# Altium project DT10965_MOTOR_CONTROLLER(1).PrjPcb (part 4 of 5)

## Sheet Pressure_sensor_AFE.SchDoc: =DT_SCH_Title
size A4; Organization: Droid Technologies; DocumentNumber: DT10965; Revision: 1.0; SheetNumber: 12; SheetTotal: 16
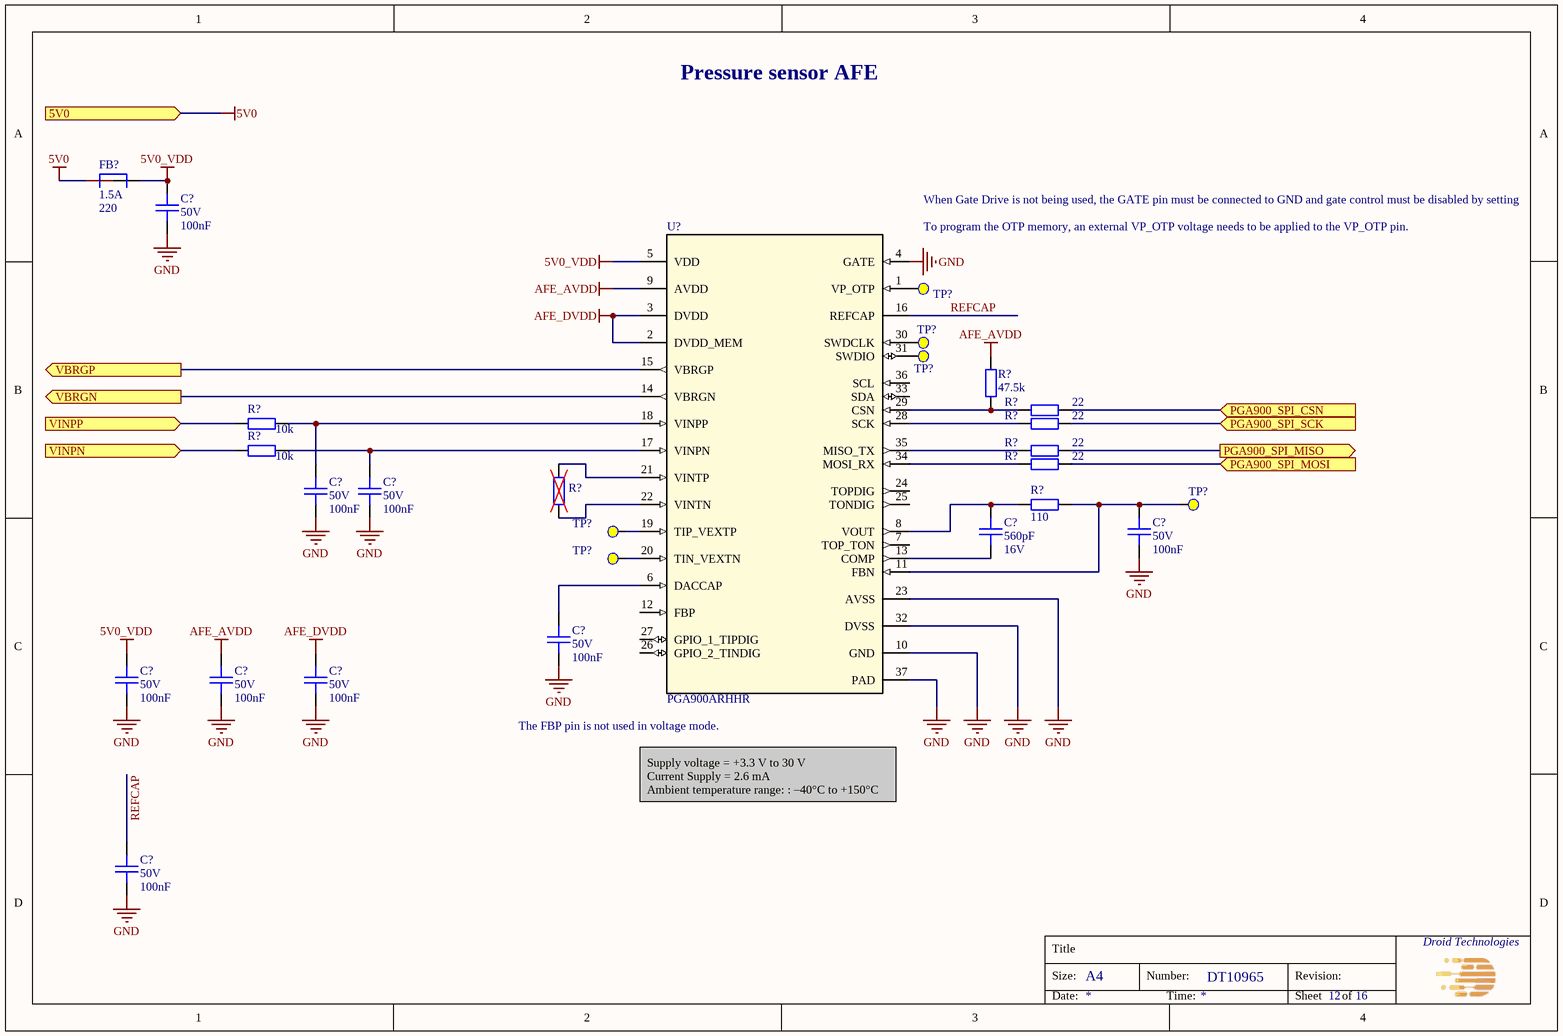
[diagram p11: Pressure_sensor_AFE.SchDoc]

### Parts
(Parts that share a designator on the sheet are numbered #1, #2 ... from top to bottom, then left to right.)
C?#24  Voltage Rating: 50V  Capacitance: 100nF  [CAPC100x50x50L25]  (hidden comment: GCM155L8EH104KE07D)
C?#25  Voltage Rating: 50V  Capacitance: 100nF  [CAPC100x50x50L25]  (hidden comment: GCM155L8EH104KE07D)
C?#26  Voltage Rating: 50V  Capacitance: 100nF  [CAPC100x50x50L25]  (hidden comment: GCM155L8EH104KE07D)
C?#27  Capacitance: 560pF  Voltage Rating: 16V  [CAPC100x50x50L25]  (hidden comment: C0402C561F4HACAUTO)
C?#28  Voltage Rating: 50V  Capacitance: 100nF  [CAPC100x50x50L25]  (hidden comment: GCM155L8EH104KE07D)
C?#29  Voltage Rating: 50V  Capacitance: 100nF  [CAPC100x50x50L25]  (hidden comment: GCM155L8EH104KE07D)
C?#30  Voltage Rating: 50V  Capacitance: 100nF  [CAPC100x50x50L25]  (hidden comment: GCM155L8EH104KE07D)
C?#31  Voltage Rating: 50V  Capacitance: 100nF  [CAPC100x50x50L25]  (hidden comment: GCM155L8EH104KE07D)
C?#32  Voltage Rating: 50V  Capacitance: 100nF  [CAPC100x50x50L25]  (hidden comment: GCM155L8EH104KE07D)
C?#33  Voltage Rating: 50V  Capacitance: 100nF  [CAPC100x50x50L25]  (hidden comment: GCM155L8EH104KE07D)
FB?#2  Imax: 1.5A  Impedance: 220  [BEADC160X80X95L40]  (hidden comment: BLM18KG221BH1D)
R?#32  Resistance: 47.5k  [RESC100X50X40L25]  (hidden comment: RC0402FR-0747K5L)
R?#33  Resistance: 22  [RESC100X50X40L25]  (hidden comment: RC0402FR-0722RL)
R?#34  Resistance: 10k  [RESC100X50X40L25]  (hidden comment: RC0402FR-0710KL)
R?#35  Resistance: 22  [RESC100X50X40L25]  (hidden comment: RC0402FR-0722RL)
R?#36  Resistance: 10k  [RESC100X50X40L25]  (hidden comment: RC0402FR-0710KL)
R?#37  Resistance: 22  [RESC100X50X40L25]  (hidden comment: RC0402FR-0722RL)
R?#38  Resistance: 22  [RESC100X50X40L25]  (hidden comment: RC0402FR-0722RL)
R?#39  Resistance: 110  [RESC100X50X40L25]  (hidden comment: RC0402FR-07110RL)
R?#40  DNP chip res 0603  [RESC160X80X55L30]  (value not drawn)
TP?#1  TPAD  [PAD_1.0R]  (value not drawn)  (no BOM)
TP?#2  TPAD  [PAD_1.0R]  (value not drawn)  (no BOM)
TP?#3  TPAD  [PAD_1.0R]  (value not drawn)  (no BOM)
TP?#4  TPAD  [PAD_1.0R]  (value not drawn)  (no BOM)
TP?#5  TPAD  [PAD_1.0R]  (value not drawn)  (no BOM)
TP?#6  TPAD  [PAD_1.0R]  (value not drawn)  (no BOM)
U?#9  PGA900ARHHR  [36VQFN]

### Ports
5V0 (in), PGA900_SPI_CSN (in), PGA900_SPI_MISO (out), PGA900_SPI_MOSI (in), PGA900_SPI_SCK (in), VBRGN (out), VBRGP (out), VINPN (in), VINPP (in)

### Nets
5V0: FB?#2.1 ; port 5V0
5V0_VDD: C?#24.2 C?#30.2 FB?#2.2 U?#9.5(VDD)
AFE_AVDD: C?#31.2 R?#32.2 U?#9.9(AVDD)
AFE_DVDD: C?#32.2 U?#9.2(DVDD_MEM) U?#9.3(DVDD)
GND: C?#24.1 C?#25.1 C?#26.1 C?#28.1 C?#29.1 C?#30.1 C?#31.1 C?#32.1 C?#33.1 U?#9.4(GATE) U?#9.10(GND) U?#9.23(AVSS) U?#9.32(DVSS) U?#9.37(PAD)
REFCAP: C?#33.2 U?#9.16(REFCAP)
NetC?#25_2: C?#25.2 R?#34.2 U?#9.18(VINPP)
NetC?#26_2: C?#26.2 R?#36.2 U?#9.17(VINPN)
NetC?#27_1: C?#27.1 U?#9.13(COMP)
NetC?#27_2: C?#27.2 R?#39.1 U?#9.8(VOUT)
NetC?#28_2: C?#28.2 R?#39.2 TP?#4.1(TPoint) U?#9.11(FBN)
NetC?#29_2: C?#29.2 U?#9.6(DACCAP)
NetR?#32_1: R?#32.1 R?#33.1 U?#9.29(CSN)
NetR?#33_2: R?#33.2 ; port PGA900_SPI_CSN
NetR?#34_1: R?#34.1 ; port VINPP
NetR?#35_1: R?#35.1 U?#9.28(SCK)
NetR?#35_2: R?#35.2 ; port PGA900_SPI_SCK
NetR?#36_1: R?#36.1 ; port VINPN
NetR?#37_1: R?#37.1 U?#9.35(MISO_TX)
NetR?#37_2: R?#37.2 ; port PGA900_SPI_MISO
NetR?#38_1: R?#38.1 U?#9.34(MOSI_RX)
NetR?#38_2: R?#38.2 ; port PGA900_SPI_MOSI
NetR?#40_1: R?#40.1 U?#9.22(VINTN)
NetR?#40_2: R?#40.2 U?#9.21(VINTP)
NetTP?#1_1: TP?#1.1(TPoint) U?#9.1(VP_OTP)
NetTP?#2_1: TP?#2.1(TPoint) U?#9.30(SWDCLK)
NetTP?#3_1: TP?#3.1(TPoint) U?#9.31(SWDIO)
NetTP?#5_1: TP?#5.1(TPoint) U?#9.19(TIP_VEXTP)
NetTP?#6_1: TP?#6.1(TPoint) U?#9.20(TIN_VEXTN)
NetU?#9_14: U?#9.14(VBRGN) ; port VBRGN
NetU?#9_15: U?#9.15(VBRGP) ; port VBRGP

Not connected (* = marked no-connect by the designer): U?#9 7(TOP_TON) 12(FBP) 24(TOPDIG) 25(TONDIG) 26(GPIO_2_TINDIG) 27(GPIO_1_TIPDIG) 33(SDA) 36(SCL)

### Notes on the sheet
- Pressure sensor AFE
- To program the OTP memory, an external VP_OTP voltage needs to be applied to the VP_OTP pin.
- When Gate Drive is not being used, the GATE pin must be connected to GND and gate control must be disabled by setting
- (near U?#9) The FBP pin is not used in voltage mode.
- Supply voltage = +3.3 V to 30 V
  Current Supply = 2.6 mA
  Ambient temperature range: : –40°C to +150°C
- Title
- Size:
- A4
- Number:
- Revision:
- Date:
- Time:
- Sheet
- of

### Library data of the parts
C?#24-C?#26 C?#28-C?#33 = CMP-001-1980-1: CAP CER 0.1UF 50V X8L 0402; Manufacturer: Murata Electronics; Op Temp max: 150°C; Op Temp min: -55°C; Tolerance: 10%; Height max: 550µm; ComponentLink3Description: Digikey; Mounting Type: SM; ComponentLink3URL: https://www.digikey.com/en/products/detail/murata-electronics/GCM155L8EH104KE07D/11618823; Package: 0402 (1005 Metric); Lead Spacing: 0mm; MPN: GCM155L8EH104KE07D; Size: 1.00mm x 0.50mm; Ratings: AEC-Q200; ComponentLink1URL: https://search.murata.co.jp/Ceramy/image/img/A01X/G101/ENG/GCM155L8EH104KE07-01.pdf; ComponentLink1Description: Datasheet; Dielectric: X8L; ComponentLink2Description: Mouser; ComponentLink2URL: https://eu.mouser.com/ProductDetail/Murata-Electronics/GCM155L8EH104KE07D?qs=1mbolxNpo8fQSHf0HYnZWw%3D%3D
C?#27 = CMP-001-2011-1: CAP CER 0402 560PF 16V ULTRA STA; Manufacturer: KEMET; Dielectric: X8R; Tolerance: 1%; Op Temp max: 150°C; Op Temp min: -55°C; Package: 0402 (1005 Metric); MPN: C0402C561F4HACAUTO; ComponentLink3Description: Digikey; Mounting Type: SM; Height max: 550µm; Lead Spacing: 0mm; ComponentLink1Description: Datasheet; ComponentLink3URL: https://www.digikey.com/en/products/detail/kemet/C0402C561F4HACAUTO/7955183?s=N4IgjCBcpgbFoDGUBmBDANgZwKYBoQB7KAbRAGYBOMAVgA4QBdAgBwBcoQBlNgJwEsAdgHMQAXwJgA7AhDJI6bPiKkQAFgBMGzfGYh2nHgJHiCGmhtnzFuAsUhltGyuQh6DkbnyGiJ4SnSUVqiYtioOIAAMTH4akWpB0HIhSnaqNLCRAAQsAGJMrByeAKqC-GwA8igAsjhoWACuvDimIAC0lknyfA3K9mQ0MbHpmSwoMUA; ComponentLink2URL: https://eu.mouser.com/ProductDetail/KEMET/C0402C561F4HACAUTO?qs=j%252B1pi9TdxUZljUlO6hXHJQ%3D%3D; ComponentLink2Description: Mouser; ComponentLink1URL: https://content.kemet.com/datasheets/KEM_C1007_X8R_ULTRA_150C_SMD.pdf; Ratings: AEC-Q200; Size: 1.00mm x 0.50mm
FB?#2 = CMP-001-1981-1: FERRITE BEAD 220 OHM 0603 1LN; Manufacturer: Murata Electronics; DCR: 50m; Op Temp min: -55°C; Frequency: 100MHz; Op Temp max: 150°C; Number of Lines: 1; Mounting Type: SM; Size: 1.60mm x 0.80mm; ComponentLink2URL: https://eu.mouser.com/ProductDetail/Murata-Electronics/BLM18KG221BH1D?qs=sJ5gq5MLFXpgEHYBdWUtkQ%3D%3D; ComponentLink1Description: Datasheet; ComponentLink1URL: https://www.murata.com/en-us/products/productdata/8798137286686/QNFA9129.pdf; Lead Spacing: 0mm; Ratings: AEC-Q200; ComponentLink3Description: Digikey; ComponentLink3URL: https://www.digikey.com/en/products/detail/murata-electronics/BLM18KG221BH1D/6156000; Height max: 950µm; Package: 0603 (1608 Metric); ComponentLink2Description: Mouser; MPN: BLM18KG221BH1D
R?#32 = CMP-001-0277-7: RES 47.5K OHM 1% 1/16W 0402; Manufacturer: YAGEO; Op Temp min: -55°C; Power: 63mW; Temperature Coefficient: ±100ppm; Op Temp max: 155°C; ComponentLink1URL: https://www.yageo.com/upload/media/product/productsearch/datasheet/rchip/PYu-RC_Group_51_RoHS_L_12.pdf; ComponentLink1Description: Datasheet; MPN: RC0402FR-0747K5L; ComponentLink3Description: Digikey; ComponentLink2URL: https://eu.mouser.com/ProductDetail/YAGEO/RC0402FR-0747K5L?qs=V1yeUXFNrklfu86Rfgihxg%3D%3D; Mounting Type: SM; Tolerance: 1%; Package: 0402 (1005 Metric); Height max: 400µm; ComponentLink2Description: Mouser; ComponentLink3URL: https://www.digikey.com/en/products/detail/yageo/RC0402FR-0747K5L/726617; Size: 1.00mm x 0.50mm; Composition: Thick Film; Ratings: -
R?#33 R?#35 R?#37 R?#38 = CMP-001-0482-4: RES 22 OHM 1% 1/16W 0402; Manufacturer: YAGEO; Temperature Coefficient: ±100ppm; Op Temp max: 155°C; Op Temp min: -55°C; Power: 63mW; Ratings: -; ComponentLink3URL: https://www.digikey.com/en/products/detail/yageo/RC0402FR-0722RL/726562; ComponentLink2URL: https://eu.mouser.com/ProductDetail/YAGEO/RC0402FR-0722RL?qs=V1yeUXFNrkkRg6zf08ADKQ%3D%3D; MPN: RC0402FR-0722RL; ComponentLink1Description: Datasheet; ComponentLink3Description: Digikey; Tolerance: 1%; Size: 1.00mm x 0.50mm; ComponentLink1URL: https://www.yageo.com/upload/media/product/productsearch/datasheet/rchip/PYu-RC_Group_51_RoHS_L_12.pdf; Composition: Thick Film; ComponentLink2Description: Mouser; Mounting Type: SM; Package: 0402 (1005 Metric); Height max: 400µm
R?#34 R?#36 = CMP-00010-6: RES 10K OHM 1% 1/16W 0402; Manufacturer: YAGEO; Op Temp max: 155°C; Op Temp min: -55°C; Power: 63mW; Temperature Coefficient: ±100ppm; ComponentLink3URL: https://www.digikey.com/en/products/detail/yageo/RC0402FR-0710KL/726523; ComponentLink1Description: Datasheet; Height max: 400µm; ComponentLink3Description: Digikey; ComponentLink2URL: https://www2.mouser.com/ProductDetail/YAGEO/RC0402FR-0710KL?qs=%2Fha2pyFaduhjtLcYvKXQ8NAGbRXkQ%2Fwl6RsvWHeV66MSeqLhkcF3rg%3D%3D; Ratings: -; MPN: RC0402FR-0710KL; ComponentLink1URL: https://www.yageo.com/upload/media/product/productsearch/datasheet/rchip/PYu-RC_Group_51_RoHS_L_12.pdf; ComponentLink2Description: Mouser; Mounting Type: SM; Tolerance: 1%; Composition: Thick Film; Size: 1.00mm x 0.50mm; Package: 0402 (1005 Metric)
R?#39 = CMP-001-0497-6: RES 110 OHM 1% 1/16W 0402; Manufacturer: YAGEO; Power: 63mW; Op Temp min: -55°C; Op Temp max: 155°C; Temperature Coefficient: ±100ppm; Size: 1.00mm x 0.50mm; ComponentLink1Description: Datasheet; Package: 0402 (1005 Metric); ComponentLink2URL: https://eu.mouser.com/ProductDetail/YAGEO/RC0402FR-07110RL?qs=QWYorlrD8IXj7iGvwWbRbA%3D%3D; MPN: RC0402FR-07110RL; ComponentLink3Description: Digikey; Height max: 400µm; Ratings: -; ComponentLink3URL: https://www.digikey.com/en/products/detail/yageo/RC0402FR-07110RL/2827583; Composition: Thick Film; ComponentLink2Description: Mouser; Tolerance: 1%; Mounting Type: SM; ComponentLink1URL: https://www.yageo.com/upload/media/product/productsearch/datasheet/rchip/PYu-RC_Group_51_RoHS_L_12.pdf
R?#40 = CMP-001-0920-3: DNP res 0603; Mounting Type: SM; MPN: DNP; Package: 0603 (1608 Metric)
TP?#1-TP?#6 = TPAD: Test Pad, SMD; Group: Test point
U?#9 = PGA900ARHHR: IC PROG SENSOR SGNL COND 36VQFN; Manufacturer: Texas Instruments; MPN: PGA900ARHHR

## Sheet Calendar.SchDoc: =DT_SCH_Title
size A4; Organization: Droid Technologies; DocumentNumber: DT10965; Revision: 1.0; SheetNumber: 16; SheetTotal: 20
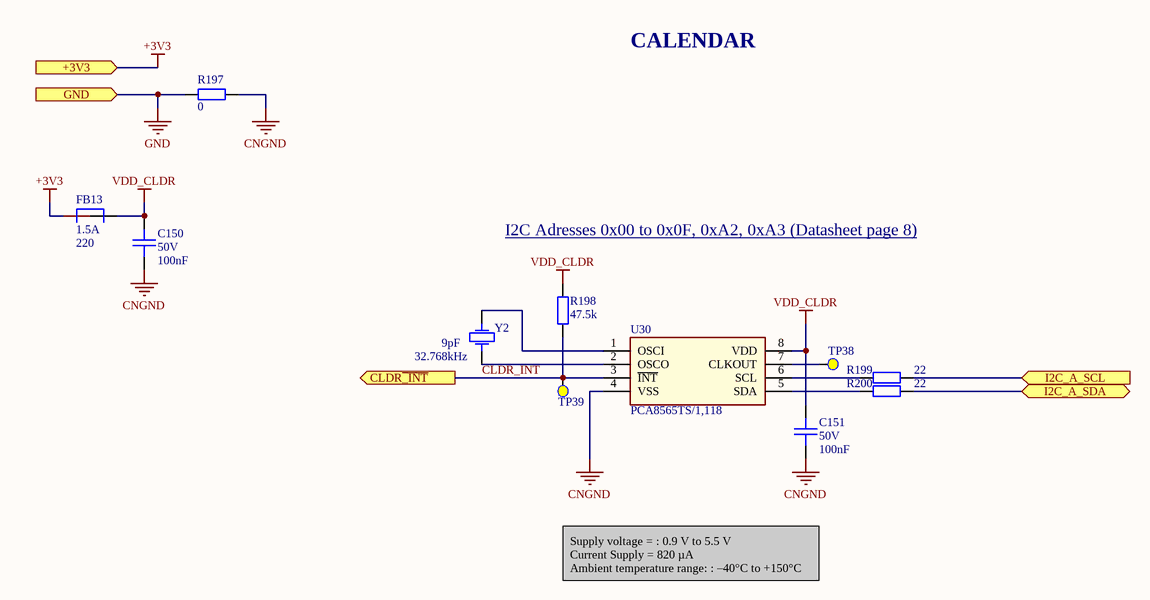
[diagram p12: Calendar.SchDoc]

### Parts
C150  Voltage Rating: 50V  Capacitance: 100nF  [CAPC100x50x50L25]  (hidden comment: GCM155L8EH104KE07D)
C151  Voltage Rating: 50V  Capacitance: 100nF  [CAPC100x50x50L25]  (hidden comment: GCM155L8EH104KE07D)
FB13  Imax: 1.5A  Impedance: 220  [BEADC160X80X95L40]  (hidden comment: BLM18KG221BH1D)
R197  Resistance: 0  [RESC160X80X55L30]  (hidden comment: RC0603FR-070RL)
R198  Resistance: 47.5k  [RESC100X50X40L25]  (hidden comment: RC0402FR-0747K5L)
R199  Resistance: 22  [RESC100X50X40L25]  (hidden comment: RC0402FR-0722RL)
R200  Resistance: 22  [RESC100X50X40L25]  (hidden comment: RC0402FR-0722RL)
TP38  TPAD  [PAD_1.0R]  (value not drawn)  (no BOM)
TP39  TPAD  [PAD_1.0R]  (value not drawn)  (no BOM)
U30  PCA8565TS/1,118  [MINISOIC-8]
Y2  C load: 9pF  F: 32.768kHz  [XTALDFN2_320X150X85L75X150]  (hidden comment: ABS07AIG-32.768KHZ-9-1-T)

### Ports
+3V3 (in), CLDR~{_INT} (out), GND (in), I2C_A_SCL (in), I2C_A_SDA (bidir)

### Nets
+3V3: FB13.1 ; port +3V3
CNGND: C150.1 C151.1 R197.1 U30.4(VSS)
GND: R197.2 ; port GND
VDD_CLDR: C150.2 C151.2 FB13.2 R198.2 U30.8(VDD)
CLDR~{_INT}: R198.1 TP39.1(TPoint) U30.3(~{INT}) ; port CLDR~{_INT}
I2C_A_SCL: R199.2 ; port I2C_A_SCL
I2C_A_SDA: R200.2 ; port I2C_A_SDA
NetR199_1: R199.1 U30.6(SCL)
NetR200_1: R200.1 U30.5(SDA)
NetTP38_1: TP38.1(TPoint) U30.7(CLKOUT)
NetU30_1: U30.1(OSCI) Y2.1
NetU30_2: U30.2(OSCO) Y2.2

### Notes on the sheet
- CALENDAR
- I2C Adresses 0x00 to 0x0F, 0xA2, 0xA3 (Datasheet page 8) <https://www.nxp.com/docs/en/data-sheet/PCA8565.pdf>
- Supply voltage = : 0.9 V to 5.5 V
  Current Supply = 820 µA
  Ambient temperature range: : –40°C to +150°C
- Title
- Size:
- A4
- Number:
- Revision:
- Date:
- Time:
- Sheet
- of

### Library data of the parts
C150 C151 = CMP-001-1980-2: CAP CER 0.1UF 50V X8L 0402; Manufacturer: Murata Electronics; Op Temp max: 150°C; Op Temp min: -55°C; Tolerance: 10%; Height max: 550µm; ComponentLink3Description: Digikey; Mounting Type: SM; ComponentLink3URL: https://www.digikey.com/en/products/detail/murata-electronics/GCM155L8EH104KE07D/11618823; Package: 0402 (1005 Metric); Lead Spacing: 0mm; MPN: GCM155L8EH104KE07D; Size: 1.00mm x 0.50mm; Ratings: AEC-Q200; ComponentLink1URL: https://www.murata.com/en-us/products/productdetail?partno=GCM155L8EH104KE07%23; ComponentLink1Description: Datasheet; Dielectric: X8L; ComponentLink2Description: Mouser; ComponentLink2URL: https://eu.mouser.com/ProductDetail/Murata-Electronics/GCM155L8EH104KE07D?qs=1mbolxNpo8fQSHf0HYnZWw%3D%3D
FB13 = CMP-001-1981-1: as FB?#2 on sheet Pressure_sensor_AFE; Mounting Type: SM; Size: 1.60mm x 0.80mm; ComponentLink2URL: https://eu.mouser.com/ProductDetail/Murata-Electronics/BLM18KG221BH1D?qs=sJ5gq5MLFXpgEHYBdWUtkQ%3D%3D; ComponentLink1Description: Datasheet; ComponentLink1URL: https://www.murata.com/en-us/products/productdata/8798137286686/QNFA9129.pdf; Lead Spacing: 0mm; Ratings: AEC-Q200; ComponentLink3Description: Digikey; ComponentLink3URL: https://www.digikey.com/en/products/detail/murata-electronics/BLM18KG221BH1D/6156000; Height max: 950µm; Package: 0603 (1608 Metric); ComponentLink2Description: Mouser; MPN: BLM18KG221BH1D
R197 = CMP-001-0927-2: as R?#6-R?#8 on sheet Phase Current_Voltage Sense; Height max: 550µm; ComponentLink2URL: https://eu.mouser.com/ProductDetail/YAGEO/RC0603FR-070RL?qs=0yPvnVz5%2FmpDQv43TwvCfw%3D%3D; Temperature Coefficient: -; ComponentLink3Description: Digikey; ComponentLink2Description: Mouser; MPN: RC0603FR-070RL; ComponentLink1URL: https://www.yageo.com/upload/media/product/productsearch/datasheet/rchip/PYu-RC_Group_51_RoHS_L_12.pdf; Ratings: -; Size: 1.60mm x 0.80mm; Composition: Thick Film; Mounting Type: SM; ComponentLink3URL: https://www.digikey.com/en/products/detail/yageo/RC0603FR-070RL/1304008; Package: 0603 (1608 Metric); ComponentLink1Description: Datasheet
R198 = CMP-001-0277-7: as R?#32 on sheet Pressure_sensor_AFE; ComponentLink1URL: https://www.yageo.com/upload/media/product/productsearch/datasheet/rchip/PYu-RC_Group_51_RoHS_L_12.pdf; ComponentLink1Description: Datasheet; MPN: RC0402FR-0747K5L; ComponentLink3Description: Digikey; ComponentLink2URL: https://eu.mouser.com/ProductDetail/YAGEO/RC0402FR-0747K5L?qs=V1yeUXFNrklfu86Rfgihxg%3D%3D; Mounting Type: SM; Tolerance: 1%; Package: 0402 (1005 Metric); Height max: 400µm; ComponentLink2Description: Mouser; ComponentLink3URL: https://www.digikey.com/en/products/detail/yageo/RC0402FR-0747K5L/726617; Size: 1.00mm x 0.50mm; Composition: Thick Film; Ratings: -
R199 R200 = CMP-001-0482-4: as R?#33 on sheet Pressure_sensor_AFE; Ratings: -; ComponentLink3URL: https://www.digikey.com/en/products/detail/yageo/RC0402FR-0722RL/726562; ComponentLink2URL: https://eu.mouser.com/ProductDetail/YAGEO/RC0402FR-0722RL?qs=V1yeUXFNrkkRg6zf08ADKQ%3D%3D; MPN: RC0402FR-0722RL; ComponentLink1Description: Datasheet; ComponentLink3Description: Digikey; Tolerance: 1%; Size: 1.00mm x 0.50mm; ComponentLink1URL: https://www.yageo.com/upload/media/product/productsearch/datasheet/rchip/PYu-RC_Group_51_RoHS_L_12.pdf; Composition: Thick Film; ComponentLink2Description: Mouser; Mounting Type: SM; Package: 0402 (1005 Metric); Height max: 400µm
TP38 TP39 = TPAD: Test Pad, SMD; Group: Test point
U30 = PCA8565TS/1,118: IC RTC CLK/CALENDAR I2C 8TSSOP; Manufacturer: NXP USA Inc.; MPN: PCA8565TS/1,118
Y2 = CMP-001-1983-1: CRYSTAL 32.7680KHZ 9PF SMD; Manufacturer: Abracon LLC; ESR: 80k; Op Temp max: 125°C; Op Temp min: -40°C; F Tolerance: ±10ppm; Height max: 900µm; ComponentLink2Description: Mouser; Mounting Type: SM; ComponentLink3Description: Digikey; MPN: ABS07AIG-32.768KHZ-9-1-T; ComponentLink1URL: https://abracon.com/datasheets/ABS07AIG.pdf; ComponentLink2URL: https://eu.mouser.com/ProductDetail/ABRACON/ABS07AIG-32.768KHZ-9-1-T?qs=gG6m684uYP5Ouz7KwhjT2A%3D%3D; ComponentLink1Description: Datasheet; Size: 3.20mm x 1.50mm; ComponentLink3URL: https://www.digikey.com/en/products/detail/abracon-llc/ABS07AIG-32-768KHZ-9-1-T/5817553; Package: 2-SMD, No Lead; F Stability: -; Ratings: AEC-Q200

## Sheet USB_interface.SchDoc: =DT_SCH_Title
size A4; Organization: Droid Technologies; DocumentNumber: DT10965; Revision: 1.0; SheetNumber: 16; SheetTotal: 18
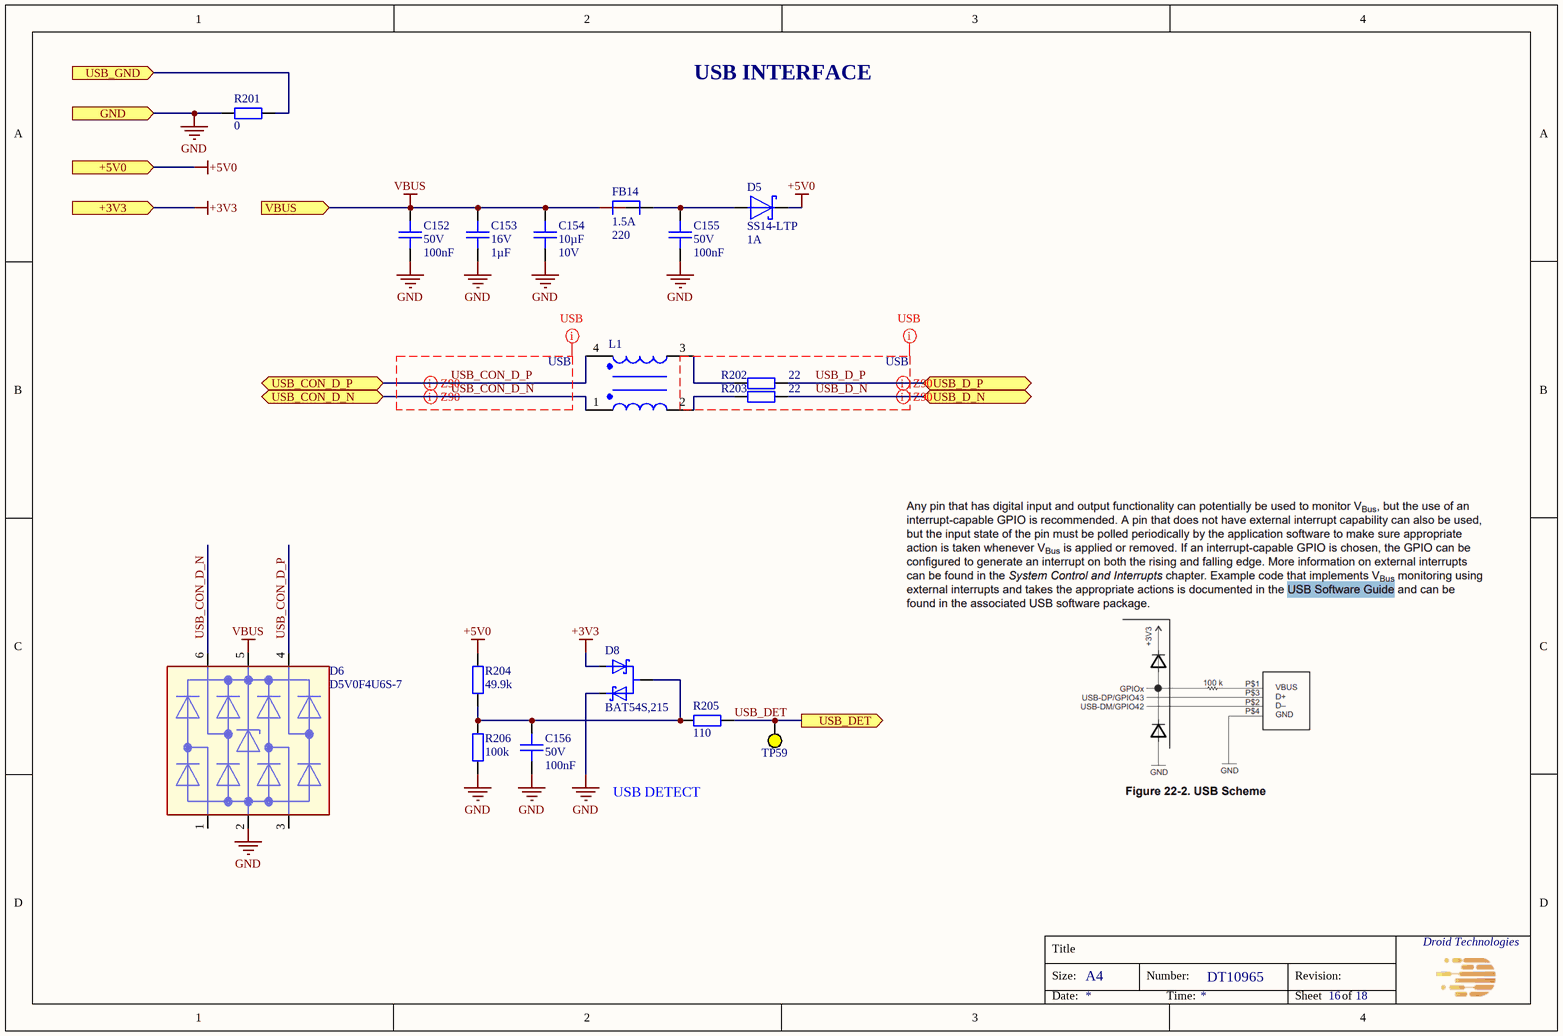
[diagram p13: USB_interface.SchDoc]

### Parts
C152  Voltage Rating: 50V  Capacitance: 100nF  [CAPC100x50x50L25]  (hidden comment: GCM155L8EH104KE07D)
C153  Voltage Rating: 16V  Capacitance: 1µF  [CAPC160X80X90L35]  (hidden comment: GCG188L8EE105KA07D)
C154  Capacitance: 10µF  Voltage Rating: 10V  [CAPC200X125X145L50]  (hidden comment: CGA4J1X8L1A106K125AC)
C155  Voltage Rating: 50V  Capacitance: 100nF  [CAPC100x50x50L25]  (hidden comment: GCM155L8EH104KE07D)
C156  Voltage Rating: 50V  Capacitance: 100nF  [CAPC100x50x50L25]  (hidden comment: GCM155L8EH104KE07D)
D5  Current - Average Rectified (Io): 1A  [DIOM520X260X290XL115X145]  (hidden comment: SS14-LTP)
D6  D5V0F4U6S-7  [SOP6P65_200X210X90L85X20]
D8  BAT54S,215  [SOT23-3P95_237X112L50X40]
FB14  Imax: 1.5A  Impedance: 220  [BEADC160X80X95L40]  (hidden comment: BLM18KG221BH1D)
L1  2 Line Common Mode Choke  [DLW21HN900SQ2L]  (value not drawn)
R201  Resistance: 0  [RESC160X80X55L30]  (hidden comment: RC0603FR-070RL)
R202  Resistance: 22  [RESC100X50X40L25]  (hidden comment: RC0402FR-0722RL)
R203  Resistance: 22  [RESC100X50X40L25]  (hidden comment: RC0402FR-0722RL)
R204  Resistance: 49.9k  [RESC100X50X40L25]  (hidden comment: RC0402FR-0749K9L)
R205  Resistance: 110  [RESC100X50X40L25]  (hidden comment: RC0402FR-07110RL)
R206  Resistance: 100k  [RESC100X50X40L25]  (hidden comment: RC0402FR-07100KL)
TP59  Test Point  [TP_D0.75mm]  (value not drawn)

### Ports
+3V3 (in), +5V0 (in), GND (in), USB_CON_D_N (bidir), USB_CON_D_P (bidir), USB_D_N (bidir), USB_D_P (bidir), USB_DET (out), USB_GND (in), VBUS (in)

### Nets
+3V3: D8.1 ; port +3V3
+5V0: D5.1 R204.2 ; port +5V0
GND: C152.1 C153.1 C154.1 C155.1 C156.1 D6.2 D8.2 R201.2 R206.1 ; port GND
VBUS: C152.2 C153.2 C154.2 D6.5 FB14.1 ; port VBUS
USB_CON_D_N: D6.6 L1.1 ; port USB_CON_D_N
USB_CON_D_P: D6.4 L1.4 ; port USB_CON_D_P
USB_D_N: R203.2 ; port USB_D_N
USB_D_P: R202.2 ; port USB_D_P
USB_DET: R205.2 TP59.1 ; port USB_DET
NetC155_2: C155.2 D5.2 FB14.2
NetC156_2: C156.2 D8.3 R204.1 R205.1 R206.2
NetL1_2: L1.2 R203.1
NetL1_3: L1.3 R202.1
NetR201_1: R201.1 ; port USB_GND

Not connected (* = marked no-connect by the designer): D6 1 3

### Layout directives
differential pair: USB_CON_D_N, USB_CON_D_P, USB_D_N, USB_D_P
net class USB: USB_CON_D_N, USB_CON_D_P, USB_D_N, USB_D_P

### Notes on the sheet
- USB INTERFACE
- USB DETECT
- Title
- Size:
- A4
- Number:
- Revision:
- Date:
- Time:
- Sheet
- of

### Library data of the parts
C152 C155 C156 = CMP-001-1980-2: as C150 on sheet Calendar; Height max: 550µm; ComponentLink3Description: Digikey; Mounting Type: SM; ComponentLink3URL: https://www.digikey.com/en/products/detail/murata-electronics/GCM155L8EH104KE07D/11618823; Package: 0402 (1005 Metric); Lead Spacing: 0mm; MPN: GCM155L8EH104KE07D; Size: 1.00mm x 0.50mm; Ratings: AEC-Q200; ComponentLink1URL: https://www.murata.com/en-us/products/productdetail?partno=GCM155L8EH104KE07%23; ComponentLink1Description: Datasheet; Dielectric: X8L; ComponentLink2Description: Mouser; ComponentLink2URL: https://eu.mouser.com/ProductDetail/Murata-Electronics/GCM155L8EH104KE07D?qs=1mbolxNpo8fQSHf0HYnZWw%3D%3D
C153 = CMP-001-1982-2: CAP CER 1UF 16V X8L 0603; Manufacturer: Murata Electronics; Tolerance: 10%; Op Temp min: -55°C; Op Temp max: 150°C; ComponentLink3URL: https://www.digikey.com/en/products/detail/murata-electronics/GCG188L8EE105KA07D/10695125; Package: 0603 (1608 Metric); MPN: GCG188L8EE105KA07D; ComponentLink2URL: https://eu.mouser.com/ProductDetail/Murata-Electronics/GCG188L8EE105KA07D?qs=rrS6PyfT74dFMfTR80dVTA%3D%3D; Dielectric: X8L; Size: 1.60mm x 0.80mm; ComponentLink1Description: Datasheet; ComponentLink1URL: https://www.murata.com/en-us/products/productdetail?partno=GCG188L8EE105KA07%23; ComponentLink2Description: Mouser; Height max: 900µm; Mounting Type: SM; ComponentLink3Description: Digikey; Lead Spacing: 0mm; Ratings: AEC-Q200
C154 = CMP-001-1984-2: CAP CER 10UF 10V X8L 0805; Manufacturer: TDK Corporation; Tolerance: 10%; Op Temp min: -55°C; Op Temp max: 150°C; ComponentLink3Description: Digikey; Mounting Type: SM; Ratings: AEC-Q200; ComponentLink1Description: Datasheet; ComponentLink3URL: https://www.digikey.com/en/products/detail/tdk-corporation/CGA4J1X8L1A106K125AC/9991388; Lead Spacing: 0mm; MPN: CGA4J1X8L1A106K125AC; Size: 2.00mm x 1.25mm; Height max: 1.5mm; ComponentLink2URL: https://eu.mouser.com/ProductDetail/TDK/CGA4J1X8L1A106K125AC?qs=gZXFycFWdANzH%252B2UvJJjtQ%3D%3D; Package: 0805 (2012 Metric); ComponentLink2Description: Mouser; Dielectric: X8L; ComponentLink1URL: https://product.tdk.com/en/search/capacitor/ceramic/mlcc/info?part_no=CGA4J1X8L1A106K125AC
D5 = CMP-001-0248-5: DIODE SCHOTTKY 40V 1A DO214AC; Manufacturer: Micro Commercial Co; Capacitance: 52pF; Op Temp max: 125°C; Op Temp min: -55°C; Reverse Recovery Time (trr): 0s; Voltage - Forward (Vf) (Max) @ If: 500 mV @ 1 A; ComponentLink1URL: https://www.mccsemi.com/pdf/Products/SS12-L-SS110-L(DO-214AC).pdf; Height max: 2.44mm; ComponentLink1Description: Datasheet; Package: DO-214AC, SMA; ComponentLink2Description: Mouser; Size: 5.2x2.6; Diode Type: Schottky; ComponentLink3Description: Digikey; MPN: SS14-LTP; ComponentLink2URL: https://www2.mouser.com/ProductDetail/Micro-Commercial-Components-MCC/SS14-LTP?qs=%2Fha2pyFadujIpB0%252ByFcAqIT7YGlaGT7g1IJJK3bT00s%3D; ComponentLink3URL: https://www.digikey.com/en/products/detail/micro-commercial-co/SS14-LTP/7652330?s=N4IgTCBcDaIMpwIwBYC0AZAKgBRAXQF8g; Voltage - DC Reverse (Vr) (Max): 40V; Mounting Type: SM
D6 = CMP-001-1245-2: TVS DIODE 5.5VWM 12VC SOT363; Manufacturer: Diodes Incorporated; Cap @ Freq: 0.5pF @ 1MHz; Vc: 12V; Op Temp max: 150°C; Unidirectional Channels: 4; P: 200mW; Vbr: 6V; Vrwm: 5.5V; Op Temp min: -55°C; Height max: 1.1mm; ComponentLink3URL: https://www.digikey.com/en/products/detail/diodes-incorporated/D5V0F4U6S-7/7724995?s=N4IgTCBcDaICIFYBqAGAYgFgKoDYDKAtAOwgC6AvkA; Bidirectional Channels: -; Size: 2.15mm x 2.1mm; Mounting Type: SM; ComponentLink1Description: Datasheet; ComponentLink2Description: Mouser; Package: 6-TSSOP, SC-88, SOT-363; MPN: D5V0F4U6S-7; Ratings: -; ComponentLink1URL: https://www.diodes.com/assets/Datasheets/D5V0F4U6S.pdf; ComponentLink2URL: https://eu.mouser.com/ProductDetail/Diodes-Incorporated/D5V0F4U6S-7?qs=L1DZKBg7t5HMc2d93K7aHQ%3D%3D; ComponentLink3Description: Digikey
D8 = BAT54S,215: DIODE ARR SCHOTT 30V TO236AB; Manufacturer: Nexperia USA Inc.; Diode Configuration: 1 Pair Series Connection; Current - Average Rectified (Io) (per Diode): 200mA; Voltage - Forward (Vf) (Max) @ If: 800 mV @ 100 mA; Reverse Recovery Time (trr): 5 ns; Current - Reverse Leakage @ Vr: 2 µA @ 25 V; MPN: BAT54S,215; Technology: Schottky; Voltage - DC Reverse (Vr) (Max): 30 V; ComponentLink1Description: DigiKey; ComponentLink1URL: https://www.digikey.bg/en/products/detail/nexperia-usa-inc/BAT54S-215/763218; Operating Temperature - Junction: 150°C (Max); Package / Case: TO-236-3, SC-59, SOT-23-3; Mounting Type: SM; ComponentLink2Description: Datasheet; ComponentLink2URL: https://assets.nexperia.com/documents/data-sheet/BAT54S.pdf
FB14 = CMP-001-1981-1: as FB?#2 on sheet Pressure_sensor_AFE; Mounting Type: SM; Size: 1.60mm x 0.80mm; ComponentLink2URL: https://eu.mouser.com/ProductDetail/Murata-Electronics/BLM18KG221BH1D?qs=sJ5gq5MLFXpgEHYBdWUtkQ%3D%3D; ComponentLink1Description: Datasheet; ComponentLink1URL: https://www.murata.com/en-us/products/productdata/8798137286686/QNFA9129.pdf; Lead Spacing: 0mm; Ratings: AEC-Q200; ComponentLink3Description: Digikey; ComponentLink3URL: https://www.digikey.com/en/products/detail/murata-electronics/BLM18KG221BH1D/6156000; Height max: 950µm; Package: 0603 (1608 Metric); ComponentLink2Description: Mouser; MPN: BLM18KG221BH1D
L1 = AWCU00201212900M02: CMC 330MA 2LN 90OHM SMD AEC-Q200; Manufacturer: Pulse Electronics; MPN: AWCU00201212900M02
R201 = CMP-001-0927-2: as R?#6-R?#8 on sheet Phase Current_Voltage Sense; Height max: 550µm; ComponentLink2URL: https://eu.mouser.com/ProductDetail/YAGEO/RC0603FR-070RL?qs=0yPvnVz5%2FmpDQv43TwvCfw%3D%3D; Temperature Coefficient: -; ComponentLink3Description: Digikey; ComponentLink2Description: Mouser; MPN: RC0603FR-070RL; ComponentLink1URL: https://www.yageo.com/upload/media/product/productsearch/datasheet/rchip/PYu-RC_Group_51_RoHS_L_12.pdf; Ratings: -; Size: 1.60mm x 0.80mm; Composition: Thick Film; Mounting Type: SM; ComponentLink3URL: https://www.digikey.com/en/products/detail/yageo/RC0603FR-070RL/1304008; Package: 0603 (1608 Metric); ComponentLink1Description: Datasheet
R202 R203 = CMP-001-0482-4: as R?#33 on sheet Pressure_sensor_AFE; Ratings: -; ComponentLink3URL: https://www.digikey.com/en/products/detail/yageo/RC0402FR-0722RL/726562; ComponentLink2URL: https://eu.mouser.com/ProductDetail/YAGEO/RC0402FR-0722RL?qs=V1yeUXFNrkkRg6zf08ADKQ%3D%3D; MPN: RC0402FR-0722RL; ComponentLink1Description: Datasheet; ComponentLink3Description: Digikey; Tolerance: 1%; Size: 1.00mm x 0.50mm; ComponentLink1URL: https://www.yageo.com/upload/media/product/productsearch/datasheet/rchip/PYu-RC_Group_51_RoHS_L_12.pdf; Composition: Thick Film; ComponentLink2Description: Mouser; Mounting Type: SM; Package: 0402 (1005 Metric); Height max: 400µm
R204 = CMP-00547-4: RES 49.9K OHM 1% 1/16W 0402; Manufacturer: YAGEO; Temperature Coefficient: ±100ppm; Power: 63mW; Op Temp min: -55°C; Op Temp max: 155°C; ComponentLink1Description: Datasheet; Composition: Thick Film; Ratings: -; ComponentLink2URL: https://eu.mouser.com/ProductDetail/YAGEO/RC0402FR-0749K9L?qs=QT1cPpUoD8GsWnpgOWR2jA%3D%3D; ComponentLink3URL: https://www.digikey.com/en/products/detail/yageo/RC0402FR-0749K9L/726620; ComponentLink2Description: Mouser; MPN: RC0402FR-0749K9L; Package: 0402 (1005 Metric); Mounting Type: SM; ComponentLink1URL: https://www.yageo.com/upload/media/product/productsearch/datasheet/rchip/PYu-RC_Group_51_RoHS_L_12.pdf; Size: 1.00mm x 0.50mm; Tolerance: 1%; ComponentLink3Description: Digikey; Height max: 400µm
R205 = CMP-001-0497-6: as R?#39 on sheet Pressure_sensor_AFE; Size: 1.00mm x 0.50mm; ComponentLink1Description: Datasheet; Package: 0402 (1005 Metric); ComponentLink2URL: https://eu.mouser.com/ProductDetail/YAGEO/RC0402FR-07110RL?qs=QWYorlrD8IXj7iGvwWbRbA%3D%3D; MPN: RC0402FR-07110RL; ComponentLink3Description: Digikey; Height max: 400µm; Ratings: -; ComponentLink3URL: https://www.digikey.com/en/products/detail/yageo/RC0402FR-07110RL/2827583; Composition: Thick Film; ComponentLink2Description: Mouser; Tolerance: 1%; Mounting Type: SM; ComponentLink1URL: https://www.yageo.com/upload/media/product/productsearch/datasheet/rchip/PYu-RC_Group_51_RoHS_L_12.pdf
R206 = CMP-00121-6: RES 100K OHM 1% 1/16W 0402; Manufacturer: YAGEO; Op Temp min: -55°C; Op Temp max: 155°C; Power: 63mW; Temperature Coefficient: ±100ppm; ComponentLink2Description: Mouser; Mounting Type: SM; Composition: Thick Film; ComponentLink3URL: https://www.digikey.com/en/products/detail/yageo/RC0402FR-07100KL/726526; Size: 1.00mm x 0.50mm; MPN: RC0402FR-07100KL; Tolerance: 1%; Ratings: -; ComponentLink1Description: Datasheet; ComponentLink2URL: https://eu.mouser.com/ProductDetail/YAGEO/RC0402FR-07100KL?qs=%2Fha2pyFaduhjtLcYvKXQ8IUndG0u%252BuCx1gxMxvN%252Btd7iB7mgHWsSbw%3D%3D; Package: 0402 (1005 Metric); ComponentLink1URL: https://www.yageo.com/upload/media/product/productsearch/datasheet/rchip/PYu-RC_Group_51_RoHS_L_12.pdf; ComponentLink3Description: Digikey; Height max: 400µm
TP59 = TP_0.75: Test point 0.75mm